# Altium schematic sheet Sheet8.SchDoc
size A; SheetNumber: 8; SheetTotal: 10
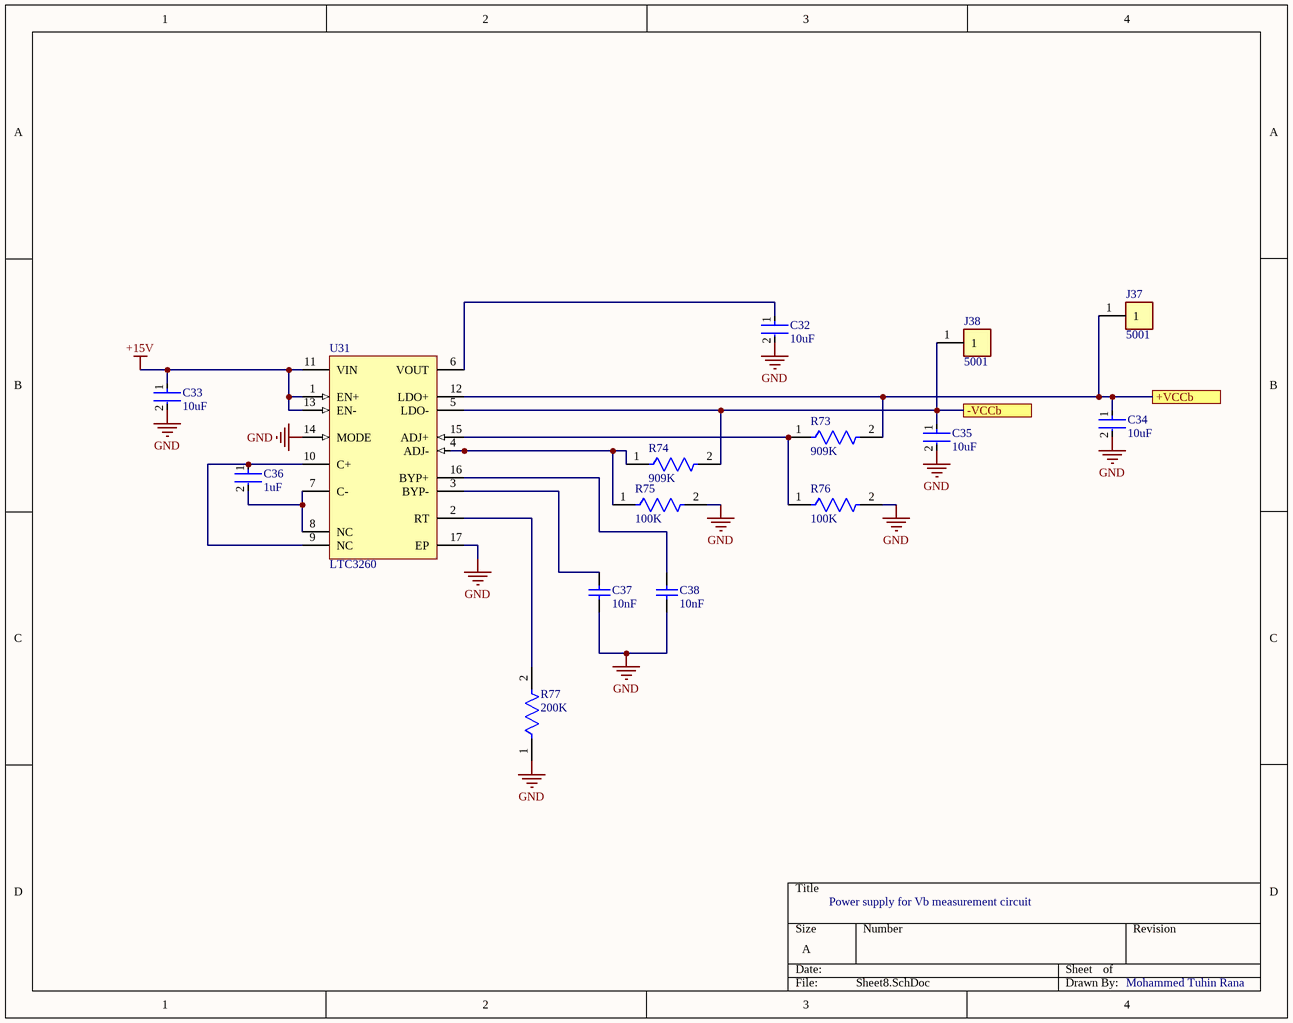
[diagram p0: Sheet8.SchDoc]

## Parts
C32  10uF  [FP-C1210C106M6PACTU-MFG]
C33  10uF  [FP-C1210C106M6PACTU-MFG]
C34  10uF  [FP-C1210C106M6PACTU-MFG]
C35  10uF  [FP-C1210C106M6PACTU-MFG]
C36  1uF  [FP-GRM55D-0_4-IPC_A]
C37  10nF  [CAPC2013X100X50NL20T25]
C38  10nF  [CAPC2013X100X50NL20T25]
J37  5001  [FP-5001-MFG]
J38  5001  [FP-5001-MFG]
R73  909K  [FP-CRCW1206-e3-IPC_C]
R74  909K  [FP-CRCW1206-e3-IPC_C]
R75  100K  [FP-AC1206-MFG]
R76  100K  [FP-AC1206-MFG]
R77  200K  [FP-CRCW1206-e3-MFG]
U31  LTC3260  [LT-MSE-16-EDP_L]

## Ports
+VCCb (see Sheet4[1A], Sheet4[1C], Sheet4[2A], Sheet4[2B], Sheet4[3B], Sheet4[3C], Sheet4[4B]), -VCCb (see Sheet4[1B], Sheet4[1D], Sheet4[2B], Sheet4[2C], Sheet4[3C], Sheet4[3D], Sheet4[4C])

## Nets
+15V: C33.1 U31.1(EN+) U31.11(VIN) U31.13(EN-)
GND: C32.2 C33.2 C34.2 C35.2 C37.1 C38.1 R75.2 R76.2 R77.1 U31.14(MODE) U31.17(EP)
+VCCb: C34.1 J37.1 R73.2 U31.12(LDO+) ; port +VCCb
-VCCb: C35.1 J38.1 R74.2 U31.5(LDO-) ; port -VCCb
NetC32_1: C32.1 U31.6(VOUT)
NetC36_1: C36.1 U31.9(NC) U31.10(C+)
NetC36_2: C36.2 U31.7(C-) U31.8(NC)
NetC37_2: C37.2 U31.3(BYP-)
NetC38_2: C38.2 U31.16(BYP+)
NetR73_1: R73.1 R76.1 U31.15(ADJ+)
NetR74_1: R74.1 R75.1 U31.4(ADJ-)
NetR77_2: R77.2 U31.2(RT)

## Notes on the sheet
- Power supply for Vb measurement circuit
- Mohammed Tuhin Rana

## Library data of the parts
C32-C35 = CMP-1038-02235-2: CAP CER 10UF 35V X5R 1210; Dissipation Factor: 2.5%; Tolerance: 20%; Dielectric Material: Ceramic; Voltage: 35V; Package Quantity: 2000; Series: C; Case Code (Metric): 3225; Length: 3.2mm; Dielectric: X5R; Height: 1.9mm; Max Operating Temperature: 85°C; Termination: SMD/SMT; Case/Package: 1210; Min Operating Temperature: -55°C; Depth: 2.5mm; Packaging: Tape and Reel; Case Code (Imperial): 1210; Width: 2.5mm; Radiation Hardening: No; Voltage Rating: 35V; Mount: Surface Mount; Voltage Rating (DC): 35V; Capacitance: 10uF; Thickness: 0.083inch; Construction: Flat; REACH SVHC: No SVHC
C36 = CMP-2000-06370-2: Chip Multilayer Ceramic Capacitors for General Purpose, 2220, 1.0uF, X7R, 15%, 10%, 250V; Width: 5mm; Capacitance: 1uF; Height: 2mm; Case Code (Imperial): 2220; Voltage Rating (DC): 250V; Max Operating Temperature: 125°C; Number of Pins: 2; Min Operating Temperature: -55°C; Termination: SMD/SMT; Case/Package: 2220; Dielectric: X7R; Material: Ceramic; REACH SVHC: No SVHC; Voltage: 250V; Packaging: Tape and Reel; Thickness: 0.087inch; Depth: 5mm; Package Quantity: 1; Tolerance: 10%; Mount: Surface Mount; Voltage Rating: 250V; Length: 5.7mm; Case Code (Metric): 5750; Lead Free: Lead Free
C37 C38 = CMP-2007-03708-1: Part Number: C0805F103K5RACTU; Manufacturer: Kemet
J37 J38 = CMP-2000-05181-2: PC TEST POINT MINIATURE BLACK; Body Material: Bronze; Plating: Silver; Inside Diameter: 1.27mm; Hole Diameter: 1.6mm; Number of Ports: 1; Outside Diameter: 2.54mm; Insulation: Insulated; Insulation Material: Nylon; Mount: Through Hole; RoHS Compliant: Yes; Series: THM; Height: 0.3inch; Termination: Through Hole; Material: Nylon; Packaging: Bulk; Contact Material: Bronze; REACH SVHC: No SVHC; Contact Plating: Silver; Orientation: Straight; Lead Free: Lead Free; Package Quantity: 100; Length: 7.62mm; Flammability Rating: UL94 V-0; Number of Contacts: 1; Diameter: 2.54mm; Housing Color: Black; Color: Black
R73 R74 = CMP-2003-02425-2: RES Thick Film, 909kΩ, 1%, 0.25W, 100ppm/°C, 1206; Resistance: 909kR; Power Rating: 250mW; Voltage Rating: 200V; Contact Plating: Tin; Number of Terminations: 2; Package Quantity: 10; Case Code (Imperial): 1206; Features: Automotive AEC-Q200; Termination: SMD/SMT; Lead Free: Lead Free; Depth: 1.6mm; Min Operating Temperature: -55°C; Case/Package: 1206; Width: 1.6mm; Tolerance: 1%; Military Standard: Not; Voltage Rating (DC): 200V; Composition: Thick Film; Radiation Hardening: No; Max Power Dissipation: 250mW; Packaging: Tape and Reel; Case Code (Metric): 3216; Height: 0.024inch; Temperature Coefficient: 100ppm/°C; Max Operating Temperature: 155°C; Length: 3.2mm; Weight: 0.000353oz
R75 R76 = CMP-2003-04909-2: RES SMD 100K OHM 1% 1/4W 1206; Manufacturer: Yageo; Manufacturer Part Number: AC1206FR-07100KL; Resistance: 100KΩ; Power Rating: 0.25W; Value: 100KΩ; Voltage Rating: 200V; Automotive Grade: Grade 0; Tolerance: 0.01; Mouser Description: RES SMD 100K OHM 1% 1/4W 1206; Ipc Land Pattern Name: RESC310160X55; Temperature Range Low: -55°C; Package: AC1206; Temperature: -55°C to +155°C; Device Class L3: Chip SMD Resistors; Lead Free: Yes; Temperature Range High: +155°C; Series: AC; Octopart: https://octopart.com/ac1206fr-07100kl-yageo-21711116; Height: 0.65mm; Footprint Url: http://www.yageo.com/exep/pages/download/literatures/PYu-R_Mount_10.pdf; RoHS: TRUE; Category: Res; Automotive: Yes; Composition: Thick Film; Device Class L2: Resistors; ComponentLink2URL: http://www.yageo.com/NewPortal/yageodocoutput?fileName=/pdf/R-Chip/PYu-AC_51_RoHS_L_6.pdf; Digikey Description: RES SMD 100K OHM 1% 1/4W 1206; ComponentLink2Description: Datasheet; Device Class L1: Passive Components
R77 = CMP-2003-01933-2: RES Thick Film, 200kΩ, 1%, 0.25W, 100ppm/°C, 1206; Power Rating: 250mW; Resistance: 200kR; Working Voltage: 200V; Case Code (Metric): 3216; Tolerance: 1%; Mount: Surface Mount; Packaging: Tape and Reel; Case Code (Imperial): 1206; Depth: 1.6mm; Military Standard: Not; Max Operating Temperature: 155°C; Length: 3.2mm; Radiation Hardening: No; Number of Terminations: 2; Features: Automotive AEC-Q200; Width: 1.6mm; Lead Free: Lead Free; Composition: Thick Film; Package Quantity: 10; Min Operating Temperature: -55°C; Contact Plating: Tin; Voltage Rating (DC): 200V; Temperature Coefficient: 100ppm/°C; Height: 0.55mm; Weight: 0.000353oz; Case/Package: 1206; Voltage Rating: 200V; Termination: SMD/SMT; Max Power Dissipation: 250mW
U31 = CMP-0475-00260-1: Low Noise Dual Supply Inverting Charge Pump, 4.5 to 32 V Vin, Adjustable Vout, 16-pin SOP (MSE-16-EDP), -40 to 125 degC, Pb-Free, Tape and Reel; PartNumber: LTC3260EMSE#TRPBF; Manufacturer: Linear Technology; Max Iout(mA): 100; Isupply(mA): 0.1; Ishutdown(uA): 2; Vin Min(V): 4.5; Frequency(kHz): 500; Vin Max(V): 32; Voutput: Adj; ComponentLink2URL: http://cds.linear.com/docs/en/datasheet/3260fa.pdf; PackageReference: MSE-16; Mounting Technology: Surface Mount; DatasheetVersion: Rev. A; ComponentLink3URL: http://cds.linear.com/docs/en/packaging/05081667_F_MSE16.pdf; ComponentLink1Description: Manufacturer URL; ComponentLink1URL: http://www.linear.com/; Packing: Tape and Reel; RoHS: TRUE; PackageDescription: 16-Pin Plastic MSOP, Exposed Die Pad, Body 4.039 x 3 mm, Pitch 0.5 mm; ComponentLink3Description: Package Specification; ComponentLink2Description: Datasheet; PackageVersion: Rev. F, 05/2013